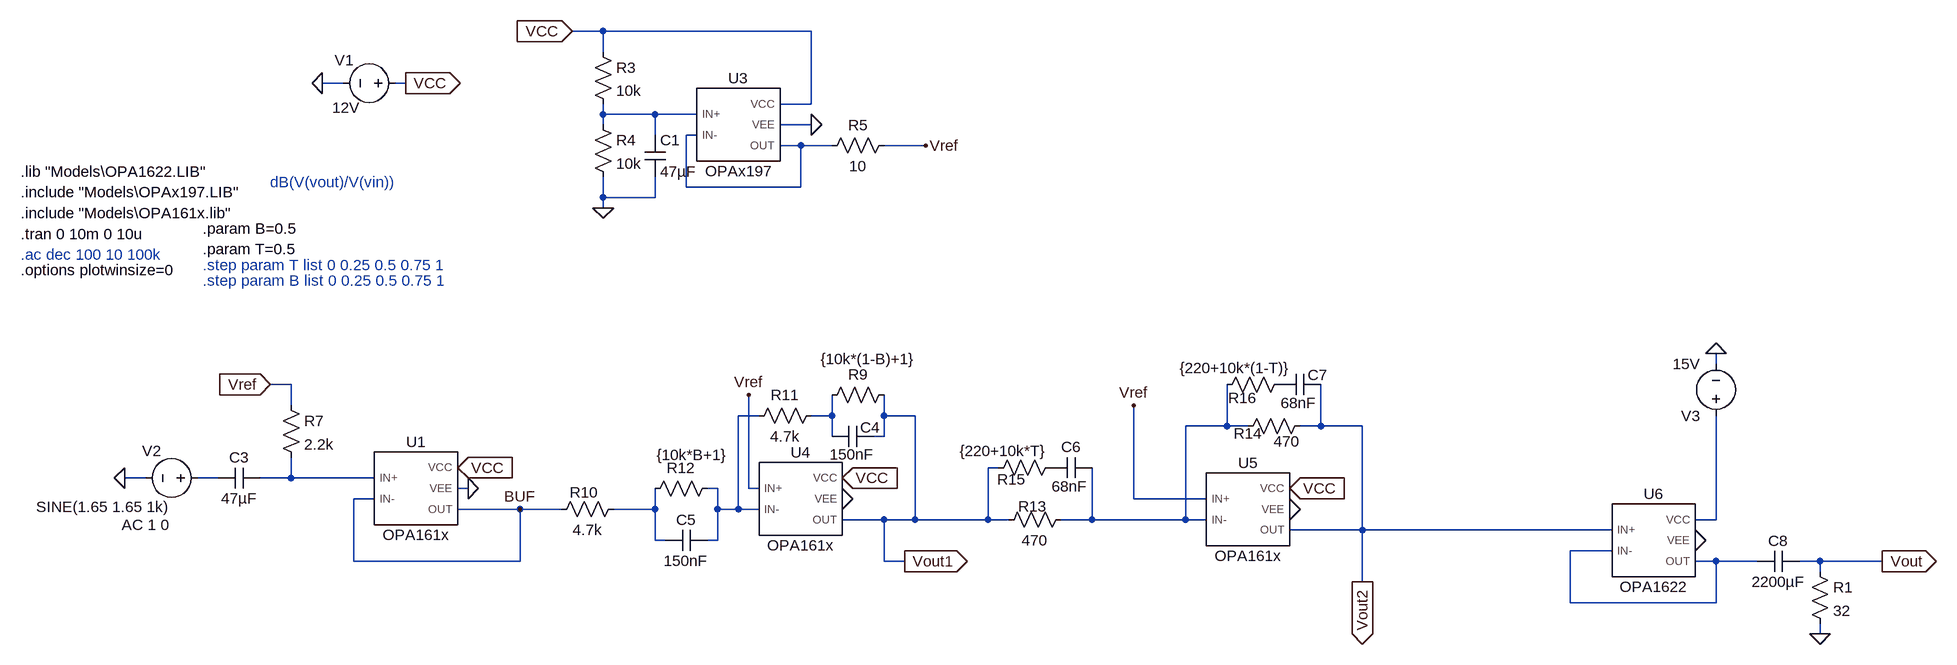
[diagram p0: schematic DAC_Amp.asc]
DAC_Amp.asc, the LTspice schematic file:
Version 4.1
SHEET 1 3392 768
WIRE 720 -608 672 -608
WIRE 1040 -608 720 -608
WIRE 720 -576 720 -608
WIRE 320 -528 288 -528
WIRE 416 -528 400 -528
WIRE 1040 -496 1040 -608
WIRE 1040 -496 992 -496
WIRE 720 -480 720 -496
WIRE 800 -480 720 -480
WIRE 864 -480 800 -480
WIRE 720 -464 720 -480
WIRE 1040 -464 992 -464
WIRE 800 -448 800 -480
WIRE 864 -448 848 -448
WIRE 1024 -432 992 -432
WIRE 1072 -432 1024 -432
WIRE 1216 -432 1152 -432
WIRE 848 -368 848 -448
WIRE 1024 -368 1024 -432
WIRE 1024 -368 848 -368
WIRE 720 -352 720 -384
WIRE 800 -352 800 -384
WIRE 800 -352 720 -352
WIRE 720 -336 720 -352
WIRE 2432 -96 2432 -112
WIRE 240 -64 208 -64
WIRE 240 -32 240 -64
WIRE 960 -16 928 -16
WIRE 1072 -16 1072 -48
WIRE 1072 -16 1040 -16
WIRE 1152 -16 1152 -48
WIRE 1200 -16 1152 -16
WIRE 1680 0 1680 -64
WIRE 1680 0 1616 0
WIRE 1712 0 1680 0
WIRE 1824 0 1824 -64
WIRE 1824 0 1792 0
WIRE 1888 0 1824 0
WIRE 1072 16 1072 -16
WIRE 1152 16 1152 -16
WIRE 1152 16 1136 16
WIRE 1328 64 1312 64
WIRE 16 80 -16 80
WIRE 128 80 96 80
WIRE 240 80 240 48
WIRE 240 80 192 80
WIRE 368 80 240 80
WIRE 512 96 496 96
WIRE 896 96 880 96
WIRE 944 96 944 -48
WIRE 960 96 944 96
WIRE 368 112 336 112
WIRE 1536 112 1536 -32
WIRE 1648 112 1536 112
WIRE 592 128 496 128
WIRE 656 128 592 128
WIRE 800 128 800 96
WIRE 800 128 736 128
WIRE 896 128 896 96
WIRE 928 128 928 -16
WIRE 928 128 896 128
WIRE 960 128 928 128
WIRE 1152 144 1088 144
WIRE 1200 144 1200 -16
WIRE 1200 144 1152 144
WIRE 1312 144 1312 64
WIRE 1312 144 1200 144
WIRE 1344 144 1312 144
WIRE 1472 144 1472 64
WIRE 1472 144 1424 144
WIRE 1616 144 1616 0
WIRE 1616 144 1472 144
WIRE 1648 144 1616 144
WIRE 2432 144 2432 -16
WIRE 2432 144 2400 144
WIRE 1888 160 1888 0
WIRE 1888 160 1776 160
WIRE 2272 160 1888 160
WIRE 800 176 800 128
WIRE 816 176 800 176
WIRE 896 176 896 128
WIRE 896 176 880 176
WIRE 2272 192 2208 192
WIRE 336 208 336 112
WIRE 592 208 592 128
WIRE 592 208 336 208
WIRE 1152 208 1152 144
WIRE 1184 208 1152 208
WIRE 2432 208 2400 208
WIRE 2496 208 2432 208
WIRE 2592 208 2560 208
WIRE 2688 208 2592 208
WIRE 2592 224 2592 208
WIRE 1888 240 1888 160
WIRE 2208 272 2208 192
WIRE 2432 272 2432 208
WIRE 2432 272 2208 272
WIRE 2592 320 2592 304
FLAG 288 -528 0
FLAG 512 96 0
FLAG 720 -336 0
FLAG 1040 -464 0
FLAG 1216 -432 Vref
FLAG 416 -528 VCC
IOPIN 416 -528 Out
FLAG 672 -608 VCC
IOPIN 672 -608 In
FLAG 208 -64 Vref
IOPIN 208 -64 In
FLAG -16 80 0
FLAG 496 64 VCC
IOPIN 496 64 In
FLAG 592 128 BUF
FLAG 1088 112 0
FLAG 1776 128 0
FLAG 1888 240 Vout2
IOPIN 1888 240 Out
FLAG 1184 208 Vout1
IOPIN 1184 208 Out
FLAG 944 -48 Vref
FLAG 1536 -32 Vref
FLAG 1088 80 VCC
IOPIN 1088 80 In
FLAG 1776 96 VCC
IOPIN 1776 96 In
FLAG 2432 -112 0
FLAG 2400 176 0
FLAG 2592 320 0
FLAG 2688 208 Vout
IOPIN 2688 208 Out
SYMBOL voltage 416 -528 M270
WINDOW 0 35 109 VLeft 2
WINDOW 3 -38 113 VLeft 2
WINDOW 123 0 0 Left 0
WINDOW 39 0 0 Left 0
SYMATTR InstName V1
SYMATTR Value 12V
SYMBOL voltage 112 80 R90
WINDOW 0 -42 72 VRight 2
WINDOW 123 72 59 VRight 2
WINDOW 39 0 0 Left 0
WINDOW 3 44 59 VRight 2
SYMATTR InstName V2
SYMATTR Value2 AC 1 0
SYMATTR Value SINE(1.65 1.65 1k)
SYMBOL OPA161x 432 96 R0
SYMATTR InstName U1
SYMBOL OPAx197 928 -464 R0
SYMATTR InstName U3
SYMBOL res 704 -592 R0
SYMATTR InstName R3
SYMATTR Value 10k
SYMBOL res 704 -480 R0
SYMATTR InstName R4
SYMATTR Value 10k
SYMBOL cap 784 -448 R0
SYMATTR InstName C1
SYMATTR Value 47µF
SYMBOL res 1168 -448 R90
WINDOW 0 0 56 VBottom 2
WINDOW 3 32 56 VTop 2
SYMATTR InstName R5
SYMATTR Value 10
SYMBOL res 224 -48 R0
SYMATTR InstName R7
SYMATTR Value 2.2k
SYMBOL cap 192 64 R90
WINDOW 0 0 32 VBottom 2
WINDOW 3 32 32 VTop 2
SYMATTR InstName C3
SYMATTR Value 47µF
SYMBOL res 1168 -64 R90
WINDOW 0 0 56 VBottom 2
WINDOW 3 -55 40 VTop 2
SYMATTR InstName R9
SYMATTR Value {10k*(1-B)+1}
SYMBOL cap 1136 0 R90
WINDOW 0 18 5 VBottom 2
WINDOW 3 28 33 VTop 2
SYMATTR InstName C4
SYMATTR Value 150nF
SYMBOL OPA161x 1024 112 R0
SYMATTR InstName U4
SYMBOL res 752 112 R90
WINDOW 0 6 61 VBottom 2
WINDOW 3 32 56 VTop 2
SYMATTR InstName R10
SYMATTR Value 4.7k
SYMBOL res 1056 -32 R90
WINDOW 0 0 56 VBottom 2
WINDOW 3 32 56 VTop 2
SYMATTR InstName R11
SYMATTR Value 4.7k
SYMBOL cap 880 160 R90
WINDOW 0 0 32 VBottom 2
WINDOW 3 32 32 VTop 2
SYMATTR InstName C5
SYMATTR Value 150nF
SYMBOL res 896 80 R90
WINDOW 0 0 56 VBottom 2
WINDOW 3 -51 40 VTop 2
SYMATTR InstName R12
SYMATTR Value {10k*B+1}
SYMBOL OPA161x 1712 128 R0
SYMATTR InstName U5
SYMBOL res 1440 128 R90
WINDOW 0 11 59 VBottom 2
WINDOW 3 32 56 VTop 2
SYMATTR InstName R13
SYMATTR Value 470
SYMBOL res 1808 -16 R90
WINDOW 0 43 96 VBottom 2
WINDOW 3 24 36 VTop 2
SYMATTR InstName R14
SYMATTR Value 470
SYMBOL cap 1472 48 R90
WINDOW 0 0 32 VBottom 2
WINDOW 3 29 34 VTop 2
SYMATTR InstName C6
SYMATTR Value 68nF
SYMBOL res 1424 48 R90
WINDOW 0 50 76 VBottom 2
WINDOW 3 -25 88 VTop 2
SYMATTR InstName R15
SYMATTR Value {220+10k*T}
SYMBOL cap 1824 -80 R90
WINDOW 0 17 5 VBottom 2
WINDOW 3 29 34 VTop 2
SYMATTR InstName C7
SYMATTR Value 68nF
SYMBOL res 1776 -80 R90
WINDOW 0 52 72 VBottom 2
WINDOW 3 -25 83 VTop 2
SYMATTR InstName R16
SYMATTR Value {220+10k*(1-T)}
SYMBOL OPA1622 2336 176 R0
SYMATTR InstName U6
SYMBOL voltage 2432 0 R180
WINDOW 123 0 0 Left 0
WINDOW 39 0 0 Left 0
SYMATTR InstName V3
SYMATTR Value 15V
SYMBOL cap 2560 192 R90
WINDOW 0 0 32 VBottom 2
WINDOW 3 32 32 VTop 2
SYMATTR InstName C8
SYMATTR Value 2200µF
SYMBOL res 2576 208 R0
SYMATTR InstName R1
SYMATTR Value 32
TEXT -176 -328 Left 2 !.include "Models\OPA161x.lib"
TEXT -176 -296 Left 2 !.tran 0 10m 0 10u
TEXT -176 -240 Left 2 !.options plotwinsize=0
TEXT -176 -360 Left 2 !.include "Models\OPAx197.LIB"
TEXT -176 -264 Left 2 ;.ac dec 100 10 100k
TEXT 208 -376 Left 2 ;dB(V(vout)/V(vin))
TEXT 104 -304 Left 2 !.param B=0.5\n.param T=0.5
TEXT -176 -392 Left 2 !.lib "Models\OPA1622.LIB"
TEXT 104 -248 Left 2 ;.step param T list 0 0.25 0.5 0.75 1
TEXT 104 -224 Left 2 ;.step param B list 0 0.25 0.5 0.75 1

The netlist it stands for:
* DAC_Amp.asc
V1 VCC 0 12V
V2 N006 0 SINE(1.65 1.65 1k) AC 1 0
X§U1 N007 BUF VCC 0 BUF OPA161x  ; pins IN+ IN- VCC VEE OUT
X§U3 N001 N002 VCC 0 N002 OPAx197  ; pins IN+ IN- VCC VEE OUT
R3 VCC N001 10k
R4 N001 0 10k
C1 N001 0 47µF
R5 Vref N002 10
R7 Vref N007 2.2k
C3 N007 N006 47µF
R9 Vout1 N004 {10k*(1-B)+1}
C4 Vout1 N004 150nF
X§U4 Vref N003 VCC 0 Vout1 OPA161x  ; pins IN+ IN- VCC VEE OUT
R10 N008 BUF 4.7k
R11 N004 N003 4.7k
C5 N003 N008 150nF
R12 N003 N008 {10k*B+1}
X§U5 Vref N005 VCC 0 Vout2 OPA161x  ; pins IN+ IN- VCC VEE OUT
R13 N005 Vout1 470
R14 Vout2 N005 470
C6 N005 P001 68nF
R15 P001 Vout1 {220+10k*T}
C7 Vout2 P002 68nF
R16 P002 N005 {220+10k*(1-T)}
X§U6 Vout2 N010 N009 0 N010 OPA1622  ; pins IN+ IN- VCC VEE OUT
V3 N009 0 15V
C8 Vout N010 2200µF
R1 Vout 0 32
.include "Models\OPA161x.lib"
.tran 0 10m 0 10u
.options plotwinsize=0
.include "Models\OPAx197.LIB"
* .ac dec 100 10 100k
* dB(V(vout)/V(vin))
.param B=0.5
.param T=0.5
.lib "Models\OPA1622.LIB"
* .step param T list 0 0.25 0.5 0.75 1
* .step param B list 0 0.25 0.5 0.75 1
.lib Models\OPA161x.lib
.lib Models\OPAx197.LIB
.lib Models\OPA1622.LIB
.backanno
.end